# Altium schematic sheet 04_10_POWER_INPUT.SchDoc
size 289 x 396 mm
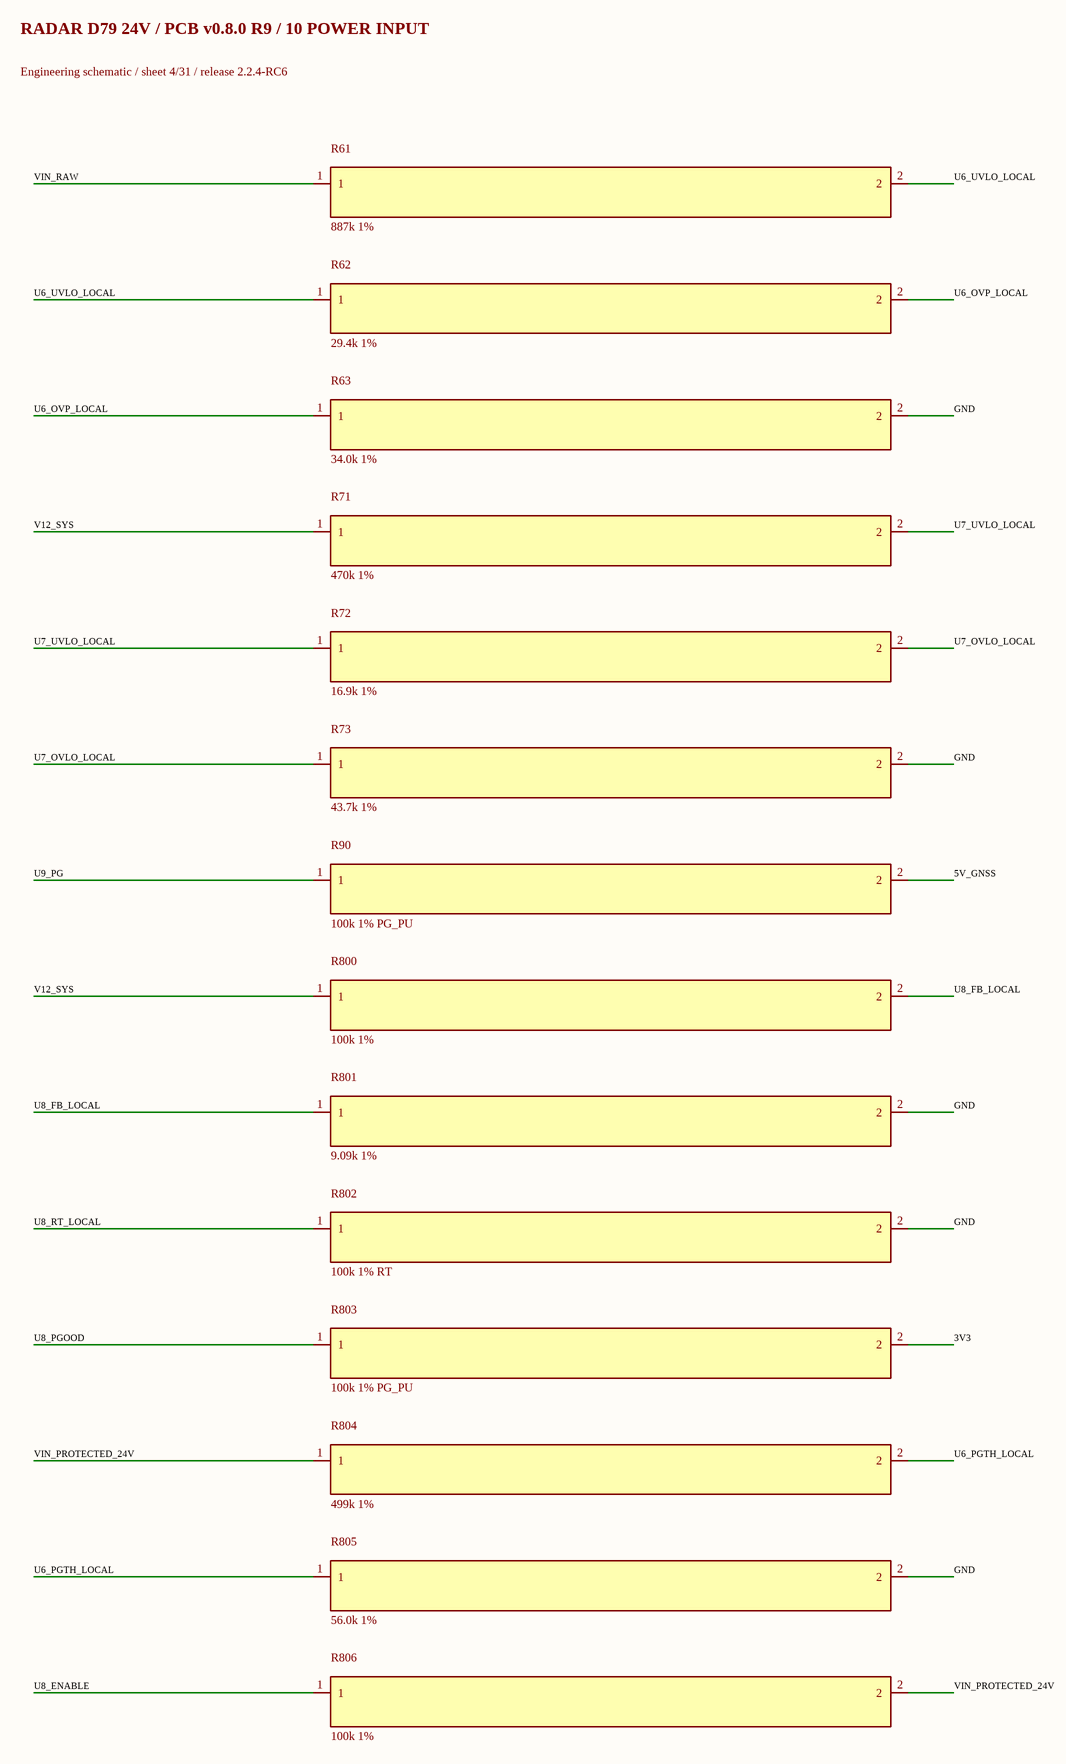
[diagram p0: 04_10_POWER_INPUT.SchDoc]

## Parts
R61  887k 1%  [R_0603_1608Metric]
R62  29.4k 1%  [R_0603_1608Metric]
R63  34.0k 1%  [R_0603_1608Metric]
R71  470k 1%  [R_0603_1608Metric]
R72  16.9k 1%  [R_0603_1608Metric]
R73  43.7k 1%  [R_0603_1608Metric]
R90  100k 1% PG_PU  [R_0603_1608Metric]
R800  100k 1%  [R_0603_1608Metric]
R801  9.09k 1%  [R_0603_1608Metric]
R802  100k 1% RT  [R_0603_1608Metric]
R803  100k 1% PG_PU  [R_0603_1608Metric]
R804  499k 1%  [R_0603_1608Metric]
R805  56.0k 1%  [R_0603_1608Metric]
R806  100k 1%  [R_0603_1608Metric]

## Nets
3V3: R803.2
5V_GNSS: R90.2
GND: R63.2 R73.2 R801.2 R802.2 R805.2
U6_OVP_LOCAL: R62.2 R63.1
U6_PGTH_LOCAL: R804.2 R805.1
U6_UVLO_LOCAL: R61.2 R62.1
U7_OVLO_LOCAL: R72.2 R73.1
U7_UVLO_LOCAL: R71.2 R72.1
U8_ENABLE: R806.1
U8_FB_LOCAL: R800.2 R801.1
U8_PGOOD: R803.1
U8_RT_LOCAL: R802.1
U9_PG: R90.1
V12_SYS: R71.1 R800.1
VIN_PROTECTED_24V: R804.1 R806.2
VIN_RAW: R61.1

## Notes on the sheet
- RADAR D79 24V / PCB v0.8.0 R9 / 10 POWER INPUT
- Engineering schematic / sheet 4/31 / release 2.2.4-RC6